# Altium schematic sheet 03-Power_Supplies.SchDoc: Power Supplies
size A4; Organization: ORGANIZATION; Address1: ADDRESS 1; Address2: ADDRESS 2; Address3: ADDRESS 3; Address4: ADDRESS 4; SheetNumber: 3; SheetTotal: 7; ENG_APP_DATE: --/--/--; DSN_APP_DATE: --/--/--; CHK_APP_DATE: --/--/--
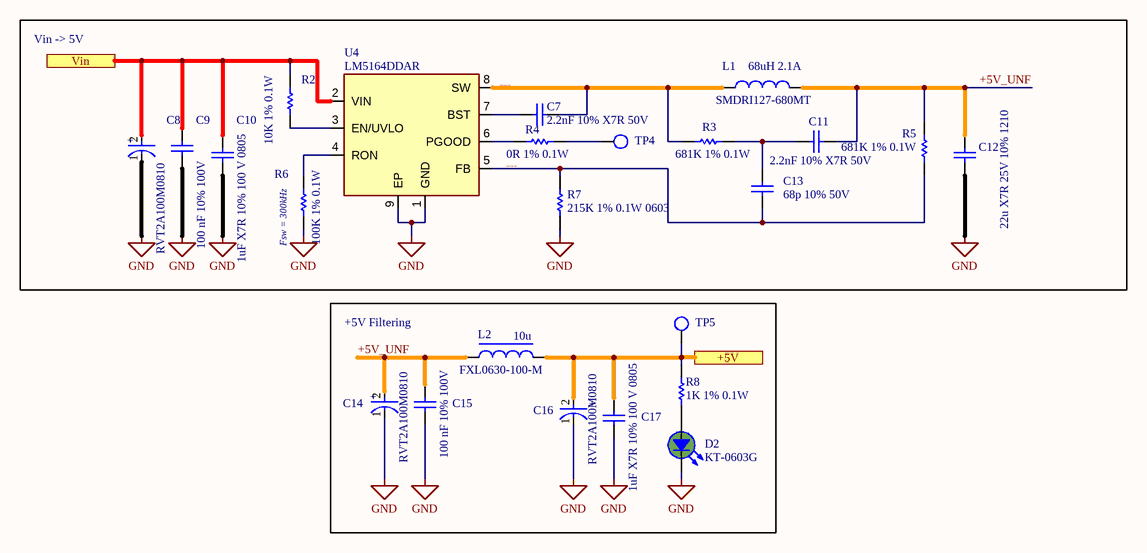
[diagram p0: 03-Power_Supplies.SchDoc]

## Parts
C7  2.2nF 10% X7R 50V  [CAPC1608X90X40NL10T20]
C8  RVT2A100M0810  [FP-SF-MFG]
C9  100 nF 10% 100V  [CAPC1608X90X40NL10T20]
C10  1uF X7R 10% 100 V 0805  [CAPC2013X95X50NL10T25]
C11  2.2nF 10% X7R 50V  [CAPC1608X90X40NL10T20]
C12  22u X7R 25V 10% 1210  [C1210]
C13  68p 10% 50V  [CAPC1608X90X40NL10T20]
C14  RVT2A100M0810  [FP-SF-MFG]
C15  100 nF 10% 100V  [CAPC1608X90X40NL10T20]
C16  RVT2A100M0810  [FP-SF-MFG]
C17  1uF X7R 10% 100 V 0805  [CAPC2013X95X50NL10T25]
D2  KT-0603G  [LED-0603-RED]
L1  SMDRI127-680MT  value 68uH 2.1A  [SUMI-CDRH127_V]
L2  FXL0630-100-M  value 10u  [INDP7066X30N]
R2  10K 1% 0.1W  [R0603]
R3  681K 1% 0.1W  [R0603]
R4  0R 1% 0.1W  [R0603]
R5  681K 1% 0.1W  [R0603]
R6  100K 1% 0.1W  [R0603]
R7  215K 1% 0.1W 0603  [R0603]
R8  1K 1% 0.1W  [R0603]
TP4  Touchpoint  [Touchpoint-Footprint-1]  (value not drawn)  (no BOM)
TP5  Touchpoint  [Touchpoint-Footprint-1]  (value not drawn)  (no BOM)
U4  LM5164DDAR  [FP-DDA0008E-IPC_B]

## Blocks framed on the sheet
Vin -> 5V: C7-C13 L1 R2-R7 TP4 U4
+5V Filtering: C14-C17 D2 L2 R8 TP5

## Ports
+5V, Vin

## Nets
GND: C8.1(C) C9.1 C10.1 C12.1 C14.1(C) C15.1 C16.1(C) C17.1 D2.2 R6.1 R7.1 U4.1(GND) U4.9(EP)
+5V: C16.2(A) C17.2 L2.2 R8.1 TP5.0 ; port +5V
+5V_UNF: C11.1 C12.2 C14.2(A) C15.2 L1.2 L2.1 R5.2
LM5164_FB: C13.1 R5.1 R7.2 U4.5(FB)
LM5164_SW: C7.1 L1.1 R3.2 U4.8(SW)
Vin: C8.2(A) C9.2 C10.2 R2.2 U4.2(VIN) ; port Vin
NetC7_2: C7.2 U4.7(BST)
NetC11_2: C11.2 C13.2 R3.1
NetD2_1: D2.1 R8.2
NetR2_1: R2.1 U4.3(EN/UVLO)
NetR4_1: R4.1 U4.6(PGOOD)
NetR4_2: R4.2 TP4.0
NetR6_2: R6.2 U4.4(RON)

## Notes on the sheet
- (near R6) Fsw = 300kHz
- Revision
- Project
- Author
- Page Title
- (in symbol CMP-001-00218-2) +

## Library data of the parts
C7 C11 = CMP-001-00213-1: Chip Capacitor, 2.2nF, 10%, 50 V, 0603; MFR_Part_#: CC0603KRX7R9BB222; Voltage Rating: 50V; LCSC_Price_1ku: 0.0021; Case/Package: 0603; LCSC_Part_#: C107082; Value: 2.2nF
C8 C14 C16 = CMP-001-00218-2: Cap Aluminum 10uF 100V 20% (8 X 10.2mm) SMD 85mA 2000 hr 85°C T/R; MFR: Honor Elec; LCSC_Price_1ku: 0.0415; LCSC_Part_#: C2895755; MFR_Part_#: RVT2A100M0810
C9 C15 = CMP-001-00209-2: Chip Capacitor, 100 nF, +/- 10%, 100 V, 0603 (1608 Metric); MFR_Part_#: CL10B104KC8NNNC; MFR: Samsung; Capacitor Type: Ceramic; Value: 100nF; Pins: 2; LCSC_Part_#: C15725; Tolerance: 10%; Max Operating Temperature: 125°C; Min Operating Temperature: -55°C; Mounting Technology: SM; Case/Package: 0603; RoHS Compliant: True; LCSC_Price_1ku: 0.0066; Voltage Rating: 100V
C10 C17 = CMP-001-00214-2: Chip Capacitor, 1 uF, X7R 10%, 100 V, 0805; MFR_Part_#: HHV0805R7105K101NSLJ; Capacitor Type: Ceramic; Voltage Rating: 100V; Pins: 2; LCSC_Price_1ku: 0.0246; Tolerance: 10%; Value: 1uF; LCSC_Part_#: C22367837; Case/Package: 0805
C12 = CMP-001-00221-1: MLCC 22u X7R 25V 10% 1210; MFR_Part_#: CL32B226KAJNNNE; PartNumber: 22u X7R 16V 10% 1210; Manufacturer: Generic; Status: Preferred; Voltage: 25V; LCSC_Price_1ku: 0.0679; LCSC_Part_#: C309062; Source: GT_WH_Control.SCHLIB; Pin Count: 2; Tolerance: 10%; Design Item ID: 2u X7R 25V 10% 1210; Dielectric: X7R; Component Type: Standard; Value: 22u
C13 = CMP-001-00202-2: Chip Capacitor, 68pF, +/- 10%, 50 V, 0603 (1608 Metric); MFR_Part_#: CC0603JRNPO9BN680; Capacitor Type: Ceramic; Tolerance: 10%; LCSC_Price_1ku: 0.0019; Max Operating Temperature: 125°C; Voltage Rating: 50V; Min Operating Temperature: -55°C; Pins: 2; RoHS Compliant: True; Case/Package: 0603; Value: 68p; Mounting Technology: SM; LCSC_Part_#: C62782
D2 = CMP-007-00044-3: 0603 Green LED; MFR_Part_#: KT-0603G; LCSC_Price_1ku: 0.0068; LCSC_Part_#: C12624
L1 = CMP-006-00046-1: 2.1A 68uH Shielded inductor ±20% 4A SMD,12.3x12.3mm Power Inductors ROHS; LCSC_Price_1ku: 0.0993; MFR_Part_#: SMDRI127-680MT; LCSC_Part_#: C9907
L2 = CMP-006-00043-1: 4.5A 10uH Molding Choke ±20% 5.5A SMD,6.6x7mm Power Inductors ROHS; LCSC_Part_#: C167223; MFR_Part_#: FXL0630-100-M; LCSC_Price_1ku: 0.0934
R2 = CMP-356-000043-3: Standard Resistor 10K 1% 0.1W 0603; MFR_Part_#: 0603WAF1002T5E; Manufacturer: Generic; TC: 200; Tolerance: 1%; Pin Count: 2; Value: 10K; Power: 0.1W; Design Item ID: 10K 1% 0.1W 0603; LCSC_Price_1ku: 0.0007; Component Type: Standard; LCSC_Part_#: C25804; Source: GT_WH_Control.SCHLIB; PartNumber: 10K 1% 0.1W 0603
R3 R5 = CMP-009-00334-2: Standard Resistor 681K 1% 0.1W 0603; Manufacturer: Generic; MFR_Part_#: 0603WAF6813T5E; Design Item ID: 681K 1% 0.1W 0603; LCSC_Price_1ku: 0.0007; PartNumber: 681K 1% 0.1W 0603; LCSC_Part_#: C23229; Component Type: Standard
R4 = CMP-356-000002-4: Standard Resistor 0R 1% 0.1W 0603; Manufacturer: Generic; MFR_Part_#: 0603WAF0000T5E; PartNumber: 0R1 1% 0.1W 0603; TC: 200; LCSC_Price_1ku: 0.0006; Component Type: Standard; Source: GT_WH_Control.SCHLIB; Tolerance: 1%; Pin Count: 2; LCSC_Part_#: C21189; Power: 0.1W; Design Item ID: 0R 1% 0.1W 0603; Value: 0R
R6 = CMP-009-00306-3: Standard Resistor 100K 1% 0.1W 0603; MFR_Part_#: 0603WAF1003T5E; Manufacturer: Generic; TC: 200; Value: 100K; Tolerance: 1%; Component Type: Standard; PartNumber: 100K 1% 0.1W 0603; LCSC_Price_1ku: 0.0007; Pin Count: 2; Source: GT_WH_Control.SCHLIB; Power: 0.1W; Design Item ID: 100K 1% 0.1W 0603; LCSC_Part_#: C25803
R7 = CMP-009-00347-1: Standard Resistor 215K 1% 0.1W 0603; MFR_Part_#: FRC0603F2153TS; Manufacturer: Generic; Design Item ID: 215K 1% 0.1W 0603; Component Type: Standard; PartNumber: 215K 1% 0.1W 0603; LCSC_Part_#: C5713280; LCSC_Price_1ku: 0.0007
R8 = CMP-009-00312-2: Standard Resistor 1K 1% 0.1W 0603; MFR_Part_#: 0603WAF1001T5E; Manufacturer: Generic; TC: 200; Tolerance: 1%; LCSC_Part_#: C21190; Value: 1K; LCSC_Price_1ku: 0.0007; Power: 0.1W; Pin Count: 2; PartNumber: 1K 1% 0.1W 0603; Design Item ID: 1K 1% 0.1W 0603; Component Type: Standard; Source: GT_WH_Control.SCHLIB
TP4 TP5 = CMP-001-0002-2: 60mils touchpoint
U4 = CMP-019-00058-2: 6-V to 100-V input, 1-A synchronous buck DC-DC converter with ultra-low IQ 8-SO PowerPAD -40 to 150; MFR_Part_#: LM5164DDAR; LCSC_Price_1ku: 0.3281; LCSC_Part_#: C477928